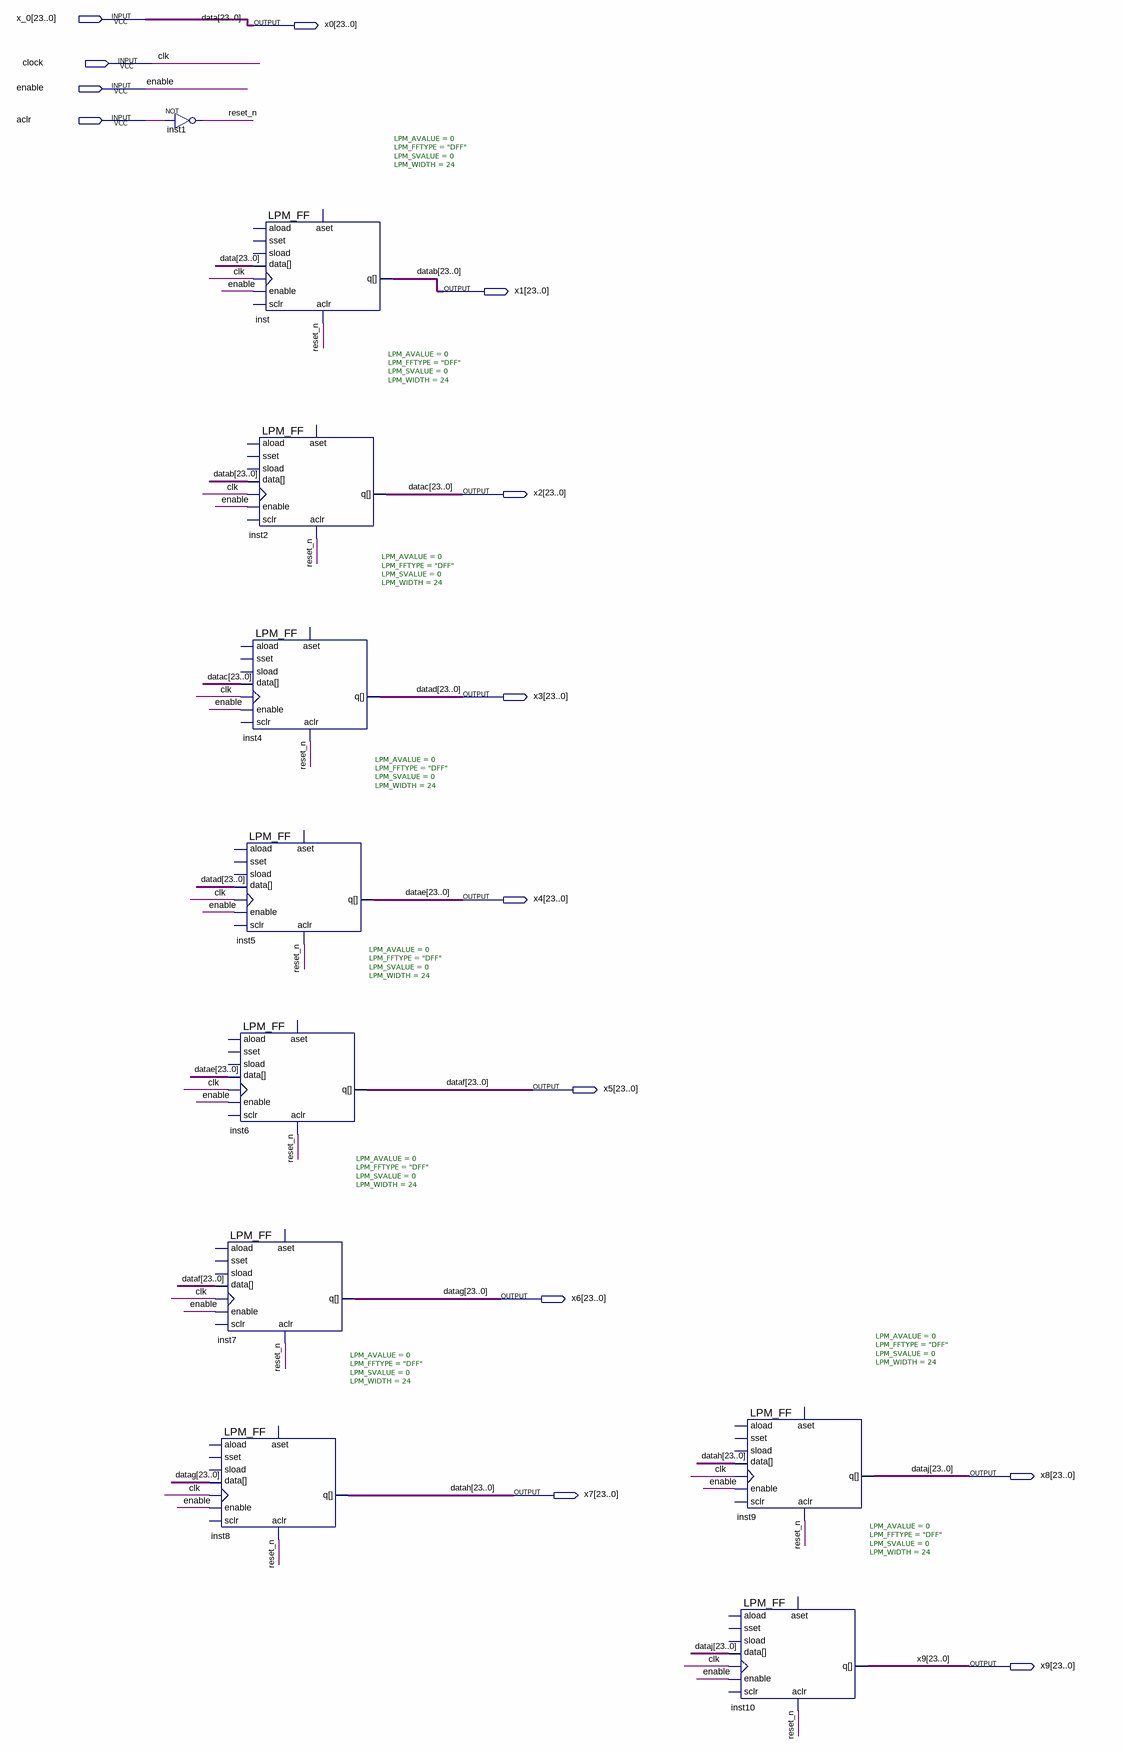
[diagram p0: schematic sheet]
// Quartus schematic Delay10.bdf as structural Verilog: 10 symbols, 14 pins
module Delay10 (
  input  [23:0] x_0,
  input  clock,
  input  enable,
  input  aclr,
  output [23:0] x0,
  output [23:0] x1,
  output [23:0] x2,
  output [23:0] x3,
  output [23:0] x4,
  output [23:0] x5,
  output [23:0] x6,
  output [23:0] x8,
  output [23:0] x7,
  output [23:0] x9
);

  wire reset_n;

  not inst1 (reset_n, aclr);
  LPM_FF #(.LPM_AVALUE(0), .LPM_FFTYPE("DFF"), .LPM_SVALUE(0), .LPM_WIDTH(24)) inst8 (
    .enable(enable), .clock(clock), .aclr(reset_n), .data(x6), .q(x7));  // open: aload, sset, sload, aset, sclr
  LPM_FF #(.LPM_AVALUE(0), .LPM_FFTYPE("DFF"), .LPM_SVALUE(0), .LPM_WIDTH(24)) inst (
    .enable(enable), .clock(clock), .aclr(reset_n), .data(x_0), .q(x1));  // open: aload, sset, sload, aset, sclr
  LPM_FF #(.LPM_AVALUE(0), .LPM_FFTYPE("DFF"), .LPM_SVALUE(0), .LPM_WIDTH(24)) inst2 (
    .enable(enable), .clock(clock), .aclr(reset_n), .data(x1), .q(x2));  // open: aload, sset, sload, aset, sclr
  LPM_FF #(.LPM_AVALUE(0), .LPM_FFTYPE("DFF"), .LPM_SVALUE(0), .LPM_WIDTH(24)) inst4 (
    .enable(enable), .clock(clock), .aclr(reset_n), .data(x2), .q(x3));  // open: aload, sset, sload, aset, sclr
  LPM_FF #(.LPM_AVALUE(0), .LPM_FFTYPE("DFF"), .LPM_SVALUE(0), .LPM_WIDTH(24)) inst5 (
    .enable(enable), .clock(clock), .aclr(reset_n), .data(x3), .q(x4));  // open: aload, sset, sload, aset, sclr
  LPM_FF #(.LPM_AVALUE(0), .LPM_FFTYPE("DFF"), .LPM_SVALUE(0), .LPM_WIDTH(24)) inst6 (
    .enable(enable), .clock(clock), .aclr(reset_n), .data(x4), .q(x5));  // open: aload, sset, sload, aset, sclr
  LPM_FF #(.LPM_AVALUE(0), .LPM_FFTYPE("DFF"), .LPM_SVALUE(0), .LPM_WIDTH(24)) inst7 (
    .enable(enable), .clock(clock), .aclr(reset_n), .data(x5), .q(x6));  // open: aload, sset, sload, aset, sclr
  LPM_FF #(.LPM_AVALUE(0), .LPM_FFTYPE("DFF"), .LPM_SVALUE(0), .LPM_WIDTH(24)) inst9 (
    .enable(enable), .clock(clock), .aclr(reset_n), .data(x7), .q(x8));  // open: aload, sset, sload, aset, sclr
  LPM_FF #(.LPM_AVALUE(0), .LPM_FFTYPE("DFF"), .LPM_SVALUE(0), .LPM_WIDTH(24)) inst10 (
    .enable(enable), .clock(clock), .aclr(reset_n), .data(x8), .q(x9));  // open: aload, sset, sload, aset, sclr

  assign x0 = x_0;

  // Other names for the same wires on the sheet: clk = clock; datac[23:0] = x2; datad[23:0] = x3; datae[23:0] = x4;
  //   dataf[23:0] = x5; datag[23:0] = x6; datah[23:0] = x7; dataj[23:0] = x8; datab[23:0] = x1; data[23:0] = x_0
endmodule
